# Altium schematic sheet Dev_Board_Connection.SchDoc
size A; Author: Jared Ainsworth; CompanyName: UpRev LLC; Engineer: Jared Ainsworth; Organization: UpRev LLC; Address1: 4807 Commercial Park Dr.; Address2: Austin, TX 78724; Address3: United States; Address4: www.UpRev.com; SheetNumber: 2; SheetTotal: 13
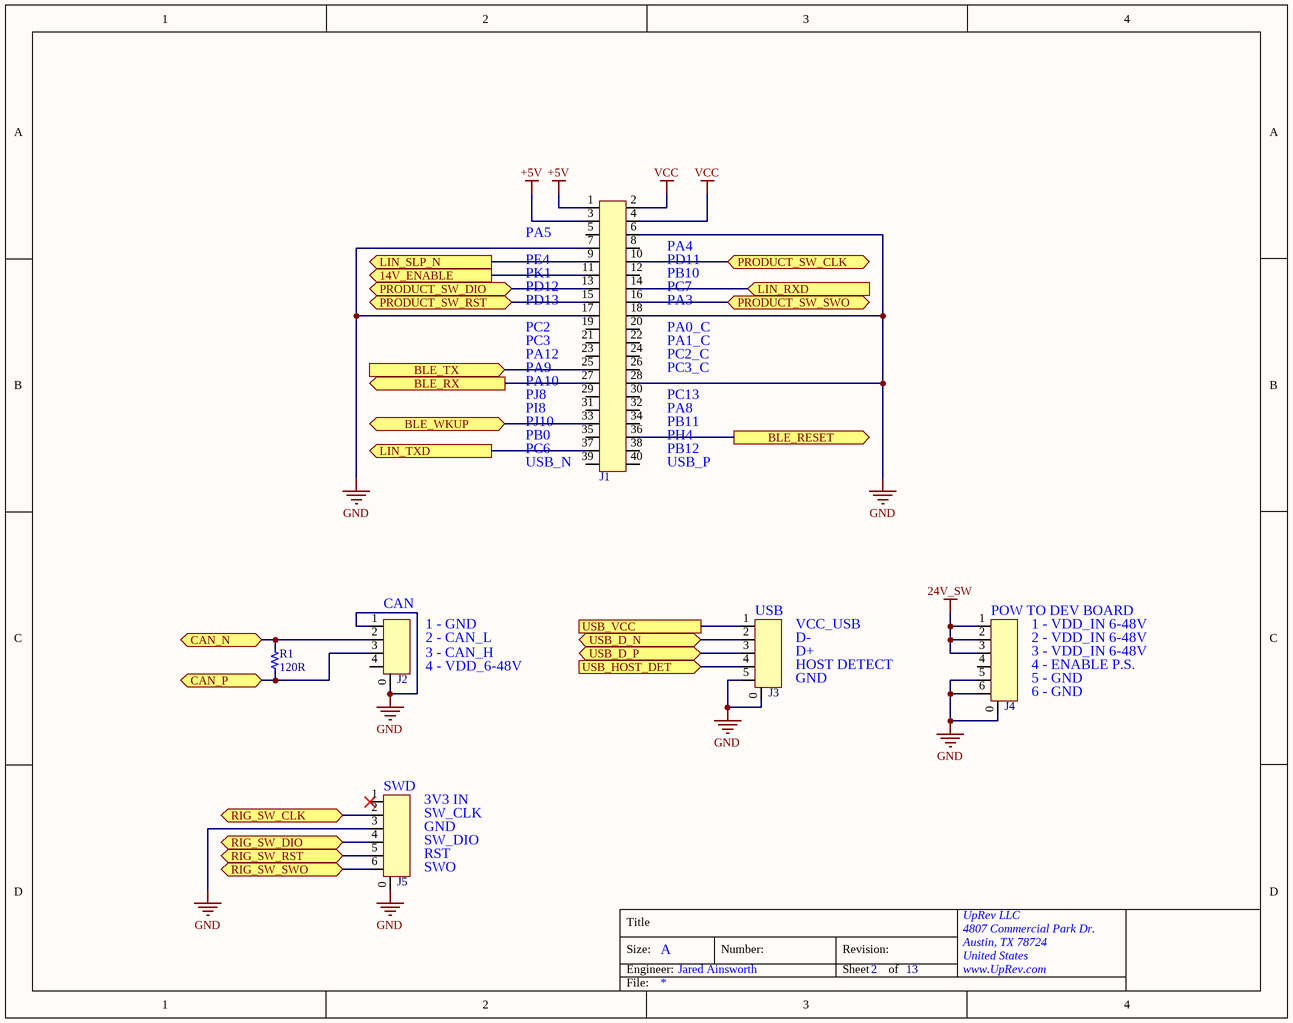
[diagram p0: Dev_Board_Connection.SchDoc]

## Parts
J1  HC-PM127-4.3H-2x20PS  [Connector 40 Pos Header 1.27mm (.5") HC-PM127-4.3H-2x20PS]  (value not drawn)
J2  532610471  [Connector 4 pos PicoBlade Molex 532610001]  (value not drawn)
J3  532610671  [Connector 5 pos PicoBlade Molex 532610571]  (value not drawn)
J4  532610571  [Connector 6 pos PicoBlade Molex 532610001]  (value not drawn)
J5  532610571  [Connector 6 pos PicoBlade Molex 532610001]  (value not drawn)
R1  120R  [R1206 (3216)]

## Ports
14V_ENABLE (out, see Top_Level[2C], Power_Supplies[2C], Vehicle_Power[1C]), BLE_RESET (out, see Top_Level[2D], Bluetooth[3B]), BLE_RX (out, see Top_Level[2D], Bluetooth[1B]), BLE_TX (in, see Top_Level[2D], Bluetooth[1C]), BLE_WKUP (bidir, see Top_Level[2D], Bluetooth[1B]), CAN_N (bidir, see Top_Level[2C], OBD_II_Connector[1B]), CAN_P (bidir, see Top_Level[2C], OBD_II_Connector[1B]), LIN_RXD (in, see Top_Level[2B], K-Line[1B], OBD_II_Connector[1B]), LIN_SLP_N (out, see Top_Level[2B], K-Line[1B], OBD_II_Connector[1B]), LIN_TXD (out, see Top_Level[2B], K-Line[1C], OBD_II_Connector[1B]), PRODUCT_SW_CLK (bidir, see Top_Level[2B], JTAG_Product_Programmer_Interface[3B]), PRODUCT_SW_DIO (bidir, see Top_Level[2B], JTAG_Product_Programmer_Interface[3B]), PRODUCT_SW_RST (bidir, see Top_Level[2B], JTAG_Product_Programmer_Interface[3C]), PRODUCT_SW_SWO (bidir, see Top_Level[2B], JTAG_Product_Programmer_Interface[3C]), RIG_SW_CLK (bidir, see Top_Level[2A], JTAG_Rig_Programmer_Interface[3B]), RIG_SW_DIO (bidir, see Top_Level[2B], JTAG_Rig_Programmer_Interface[3B]), RIG_SW_RST (bidir, see Top_Level[2B], JTAG_Rig_Programmer_Interface[3C]), RIG_SW_SWO (bidir, see Top_Level[2B], JTAG_Rig_Programmer_Interface[3C]), USB_D_N (bidir, see Top_Level[2C], USB_Host[1B]), USB_D_P (bidir, see Top_Level[2C], USB_Host[1B]), USB_HOST_DET (in, see Top_Level[2C], USB_Host[1B]), USB_VCC (see Top_Level[2C], USB_Host[1B])

## Nets
24V_SW: J4.1 J4.2 J4.3
+5V: J1.1 J1.3
GND: J1.6 J1.7 J1.17 J1.18 J1.28 J2.0 J2.1 J3.0 J3.5 J4.0 J4.5 J4.6 J5.0 J5.3
VCC: J1.2 J1.4
14V_ENABLE: J1.11 ; port 14V_ENABLE
BLE_RESET: J1.36 ; port BLE_RESET
BLE_RX: J1.27 ; port BLE_RX
BLE_TX: J1.25 ; port BLE_TX
BLE_WKUP: J1.33 ; port BLE_WKUP
CAN_N: J2.2 R1.2 ; port CAN_N
CAN_P: J2.3 R1.1 ; port CAN_P
LIN_RXD: J1.14 ; port LIN_RXD
LIN_SLP_N: J1.9 ; port LIN_SLP_N
LIN_TXD: J1.37 ; port LIN_TXD
PRODUCT_SW_CLK: J1.10 ; port PRODUCT_SW_CLK
PRODUCT_SW_DIO: J1.13 ; port PRODUCT_SW_DIO
PRODUCT_SW_RST: J1.15 ; port PRODUCT_SW_RST
PRODUCT_SW_SWO: J1.16 ; port PRODUCT_SW_SWO
RIG_SW_CLK: J5.2 ; port RIG_SW_CLK
RIG_SW_DIO: J5.4 ; port RIG_SW_DIO
RIG_SW_RST: J5.5 ; port RIG_SW_RST
RIG_SW_SWO: J5.6 ; port RIG_SW_SWO
USB_D_N: J3.2 ; port USB_D_N
USB_D_P: J3.3 ; port USB_D_P
USB_HOST_DET: J3.4 ; port USB_HOST_DET
USB_VCC: J3.1 ; port USB_VCC

Not connected (* = marked no-connect by the designer): J1 5 8 12 19 20 21 22 23 24 26 29 30 31 32 34 35 38 39 40; J2 4; J4 4; J5 1*

## Notes on the sheet
- (near J1) PA5
- (near J1) PE4
- (near J1) PK1
- (near J1) PD12
- (near J1) PA4
- (near J1) PD11
- (near J1) PB10
- (near J1) PC7
- (near J1) PD13
- (near J1) PC2
- (near J1) PC3
- (near J1) PA12
- (near J1) PA9
- (near J1) PA3
- (near J1) PA0_C
- (near J1) PA1_C
- (near J1) PC2_C
- (near J1) PC3_C
- (near J1) PA10
- (near J1) PJ8
- (near J1) PI8
- (near J1) PJ10
- (near J1) PC13
- (near J1) PA8
- (near J1) PB11
- (near J1) PB0
- (near J1) PC6
- (near J1) USB_N
- (near J1) PH4
- (near J1) PB12
- (near J1) USB_P
- (near J2) CAN
- (near J2) 1 - GND
- (near J2) 2 - CAN_L
- (near J3) USB
- (near J3) VCC_USB
- (near J3) D-
- (near J4) POW TO DEV BOARD
- (near J4) 1 - VDD_IN 6-48V
- (near J4) 2 - VDD_IN 6-48V
- (near J2) 3 - CAN_H
- (near J2) 4 - VDD_6-48V
- (near J3) D+
- (near J3) HOST DETECT
- (near J3) GND
- (near J4) 3 - VDD_IN 6-48V
- (near J4) 4 - ENABLE P.S.
- (near J4) 5 - GND
- (near J4) 6 - GND
- (near J5) SWD
- (near J5) 3V3 IN
- (near J5) SW_CLK
- (near J5) GND
- (near J5) SW_DIO
- (near J5) RST
- (near J5) SWO
- Title
- Size:
- Engineer:
- A
- Number:
- Revision:
- Sheet
- of
- File:

## Library data of the parts
J1 = HC-PM127-4.3H-2x20PS: 40 Pos, 1.27mm Pitch, Socket, Vertical SMD; Manufacturer: Hong Cheng; Package: SMD,P=1.27mm; Manufacturer Part Number: HC-PM127-4.3H-2x20PS; LCSC Part Number: C22436137
J2 = 532610471: 4 Pos, 1.25mm Pitch, PicoBlade, Horizontal SMD; Manufacturer: MOLEX; Package: SMD,P=1.25mm,Surface Mount，Right Angle; Manufacturer Part Number: 532610471; LCSC Part Number: C696092
J3 = 532610671: 5 Pos, 1.25mm Pitch, PicoBlade, Horizontal SMD; Manufacturer: MOLEX; Manufacturer Part Number: 532610571; Package: SMD,P=1.25mm,Surface Mount，Right Angle; LCSC Part Number: C17256390
J4 J5 = 532610571: 6 Pos, 1.25mm Pitch, PicoBlade, Horizontal SMD; Manufacturer: MOLEX; Manufacturer Part Number: 532610671; Package: SMD,P=1.25mm,Surface Mount，Right Angle; LCSC Part Number: C17393620
R1 = 120 ohm, 1206 (3216): 120 ohm, Resistor, ±1%, 1/4W, 1206 (3216); Manufacturer: UNI-ROYAL(Uniroyal Elec); Manufacturer Part Number: 1206W4F1200T5E; Package: 1206 (3216 metric); LCSC Part Number: C17909; Value: 120R